# EasyEDA Pro project ProPrj_CraftVia-Station-S-v1-Rev0_2026-09-30.epro, schematic Schematic1, sheet 7 of 7

## Sheets
7 07_USB_ESP: Create Date: 2026-09-25; Page Name: 07_USB_ESP; Update Date: 2026-09-25
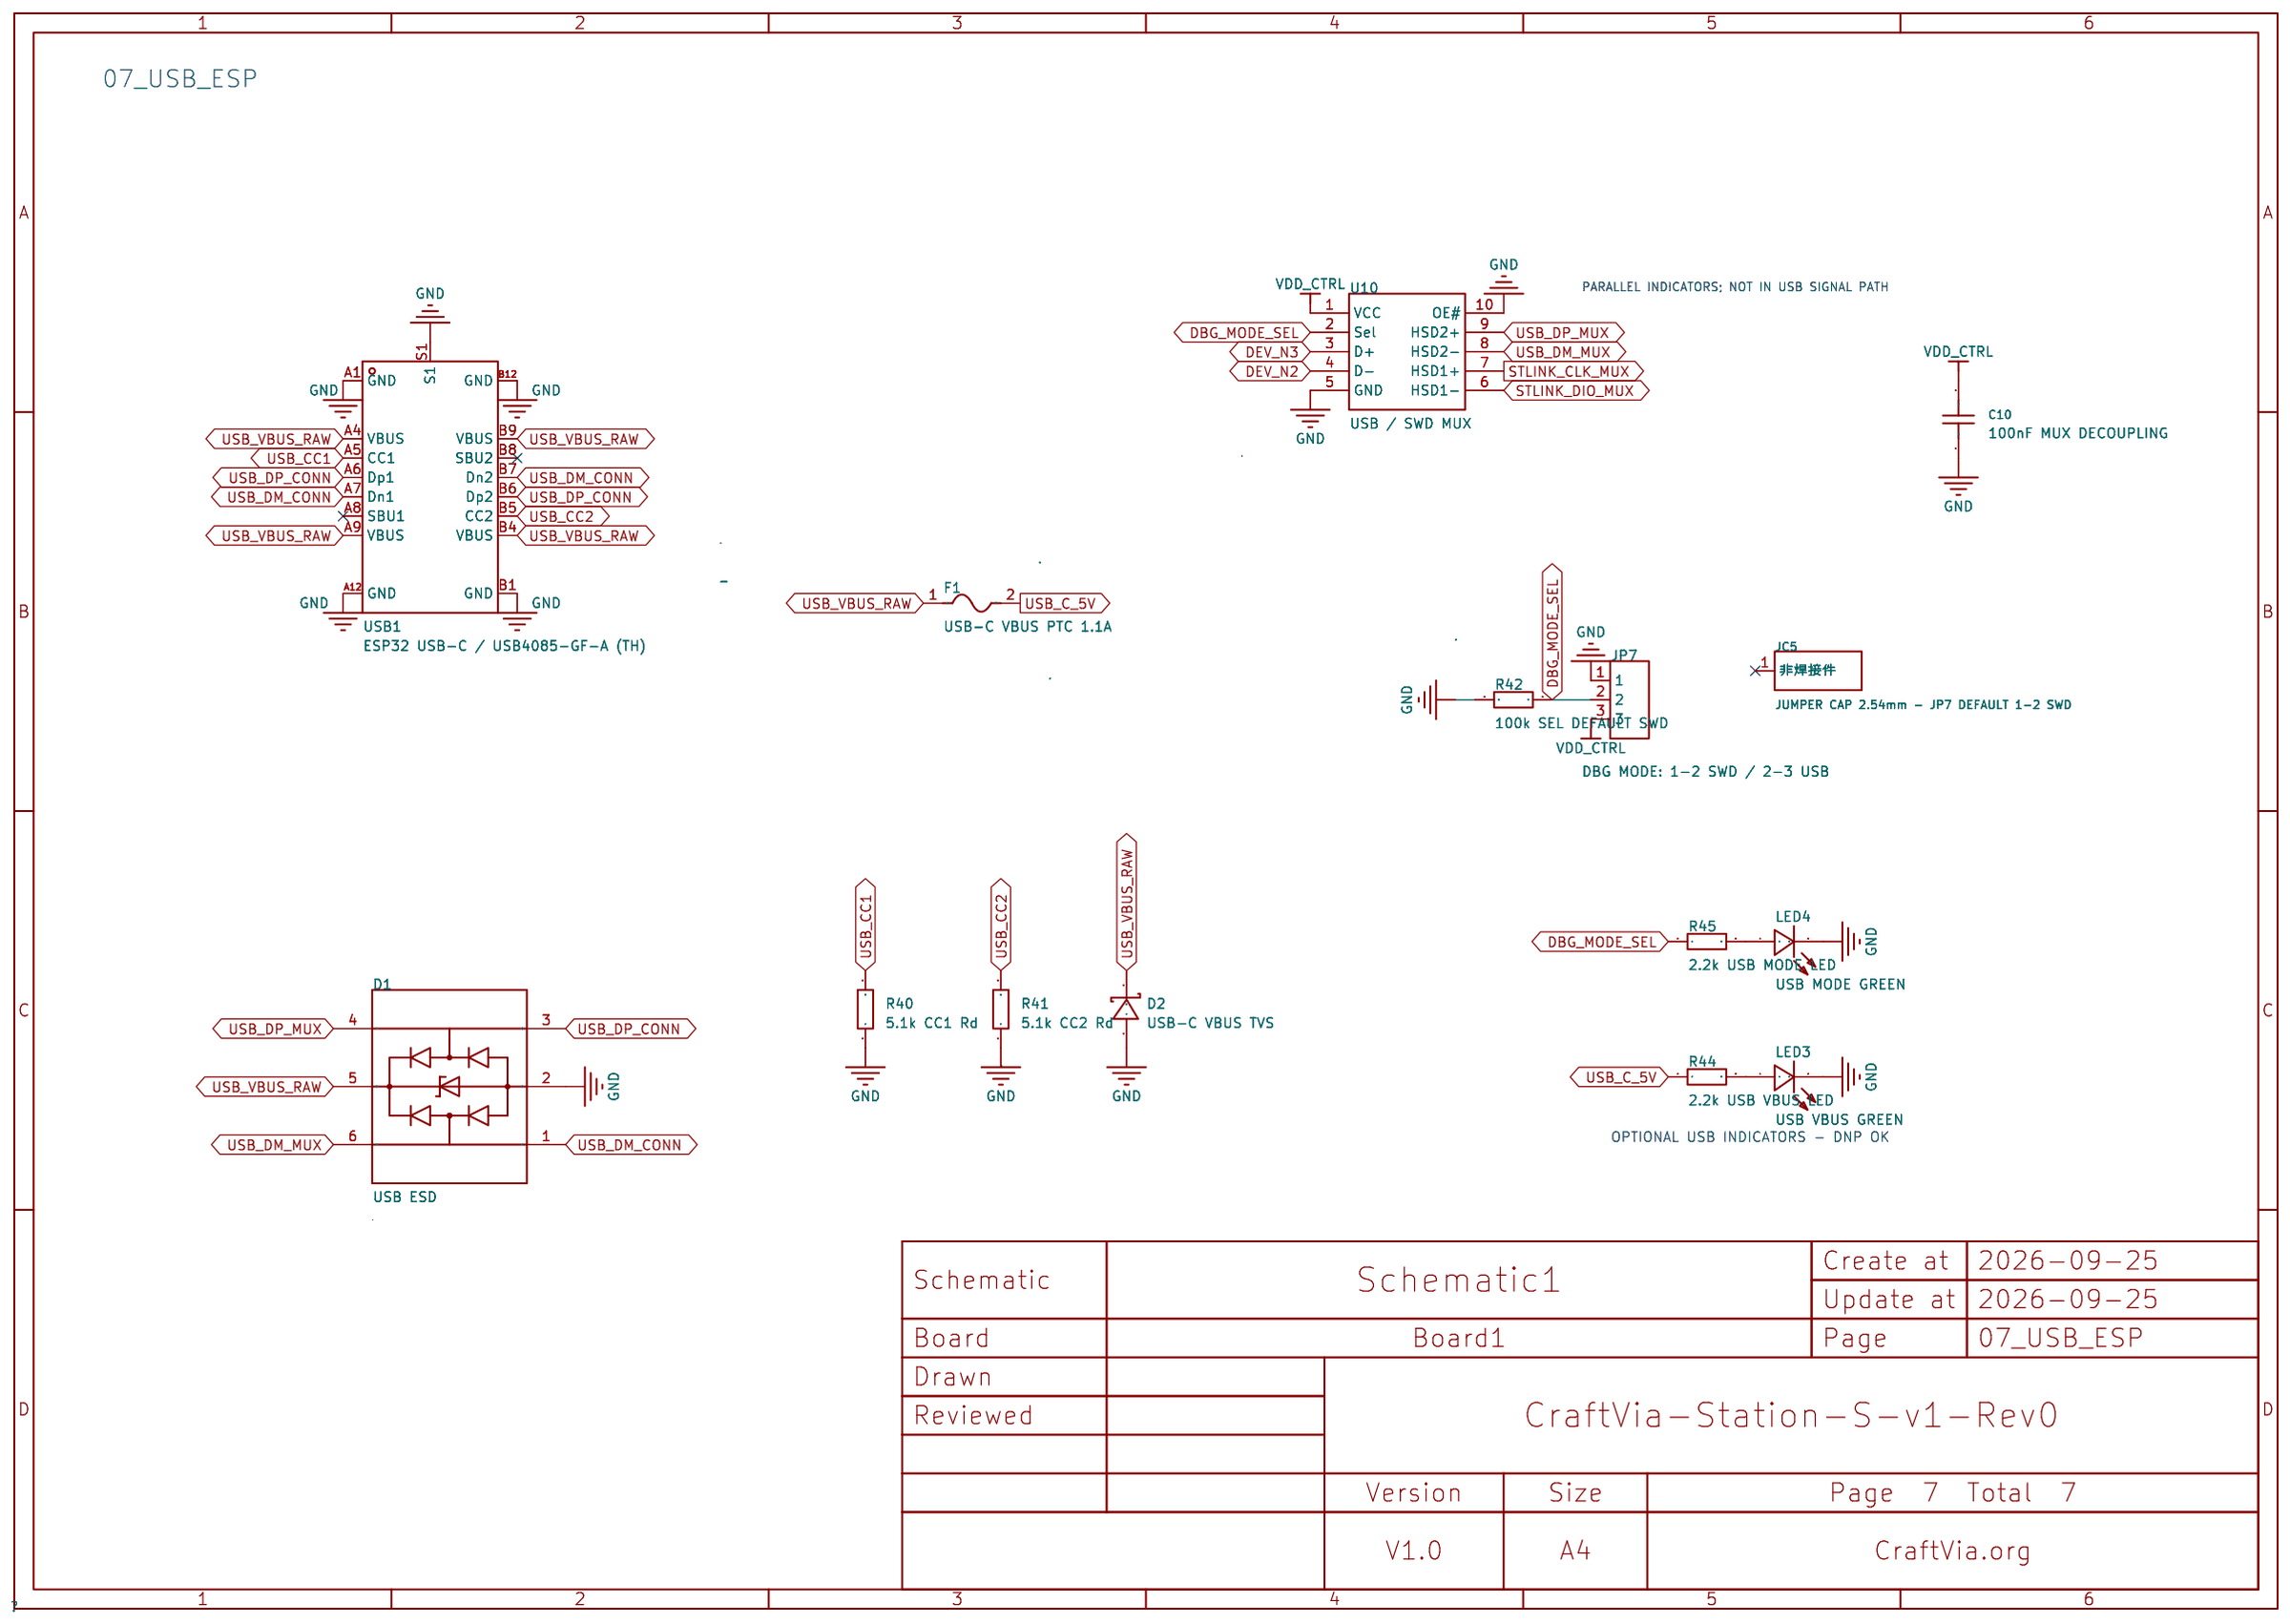
[diagram p6: 07_USB_ESP]

## Parts
C10  100nF  [C0603]
D1  USB ESD  [SOT-23-6_L2.9-W1.6-P0.95-LS2.8-BL]
D2  USB-C VBUS TVS  [SOD-123_L2.8-W1.8-LS3.7-RD]
F1  USB-C VBUS PTC 1.1A  [F1812]
JC5  JUMPER CAP 2.54mm - JP7 DEFAULT 1-2 SWD  [FL_001]
JP7  DBG MODE: 1-2 SWD / 2-3 USB  [HDR-TH_3P-P2.54-V-M_PZ254V-11-03P]
LED3  USB VBUS GREEN  [LED0805-R-RD]
LED4  USB MODE GREEN  [LED0805-R-RD]
R40  5.1kΩ  [R0603]
R41  5.1kΩ  [R0603]
R42  100kΩ  [R0603]
R44  2.2kΩ  [R0603]
R45  2.2kΩ  [R0603]
U10  USB / SWD MUX  [MSOP-10_L3.0-W3.0-P0.50-LS5.0-BL]
USB1  ESP32 USB-C / USB4085-GF-A (TH)  [USC-C-SMD_USB4085-GF-A]

## Library data of the parts
C10 = CL10B104KB8NNNC: Capacitance:100nF Tolerance:±10% Tolerance:±10% Voltage Rating:50V Temperature Coefficient:X7R; LCSC Part Name: 100nF ±10% 50V; Supplier Part: CL10B104KB8NNNC.1; Manufacturer: SAMSUNG(三星); Supplier Footprint: 0603; JLCPCB Part Class: Extended Part; Datasheet: https://item.szlcsc.com/datasheet/CL10B104KB8NNNC/1943.html; Supplier: LCSC; Tolerance: ±10%; Voltage Rating: 50V; Temperature Coefficient: X7R
D1 = USBLC6-2SC6: Reverse Stand-Off Voltage (Vrwm):5V Maximum Clamping Voltage:20V Peak Pulse Current (Ipp)@10/1000us:5A Breakdown Voltage:6V Type:ESD; LCSC Part Name: ESD二极管 USBLC6-2SC6; Supplier Part: USBLC6-2SC6_C323793.1; Supplier Footprint: SOT-23-6; JLCPCB Part Class: Extended Part; Datasheet: https://atta.szlcsc.com/upload/public/pdf/source/20181029/C323793_48F7908330A3F84485333C8DC43F9E49.pdf; Supplier: LCSC; Reverse Stand-Off Voltage (Vrwm): 5V; Maximum Clamping Voltage: 20V; Peak Pulse Current (Ipp)@10/1000us: 5A; Breakdown Voltage: 6V; Type: ESD
D2 = SMF5.0A: Reverse Stand-Off Voltage (Vrwm):5V Maximum Clamping Voltage:9.2V Peak Pulse Current (Ipp)@10/1000us:21.7A Breakdown Voltage:6.4V Type:TVS; Supplier Part: SMF5.0A.1; Supplier Footprint: SOD-123; JLCPCB Part Class: Extended Part; Datasheet: https://atta.szlcsc.com/upload/public/pdf/source/20180528/C132591_2E6627FA8E0A601785D44BCCBB8E552F.pdf; Supplier: LCSC; Reverse Stand-Off Voltage (Vrwm): 5V; Maximum Clamping Voltage: 9.2V; Peak Pulse Current (Ipp)@10/1000us: 21.7A; Breakdown Voltage: 6.4V; Type: TVS
F1 = MF-MSMF050-2: USB-C VBUS resettable PTC, 1.1A hold / 2.2A trip, 16V, 1812; LCSC Part Name: 16V 1.1A 1812 Resettable PTC; Supplier Part: C210834; Manufacturer: BOURNS; Manufacturer Part: MF-MSMF110/16-2; Supplier Footprint: 1812; JLCPCB Part Class: Extended Part; Datasheet: https://item.szlcsc.com/datasheet/MF-MSMF110%252F16-2/211712.html; Supplier: LCSC; Voltage - Max: 16V; Current - Max: 100A; Hold Current: 1.1A; Trip Current: 2.2A; Power Dissipation: 800mW; Resistance - Initial (Ri) (Min): 40mohm; Resistance - Post Trip (R1) (Max): 210mohm; Time to Trip(Max): 300ms; Operating Temperature: -40C to +85C; Length: 5.4mm; Width: 3.2mm; Height: 0.85mm
JC5 = 2.54短路帽开口: Number of Positions or Pins:1x2 Pitch:2.54mm Open Top/Close Top:Open-Top Current Rating:3A colour:Black Long Handle or Not:Unshrouded; LCSC Part Name: 2.54mm 开顶式; Supplier Part: 2.54短路帽开口.1; Manufacturer: BOOMELE(博穆精密); Supplier Footprint: P=2.54mm; JLCPCB Part Class: Extended Part; Datasheet: https://item.szlcsc.com/datasheet/2.54%25E7%259F%25AD%25E8%25B7%25AF%25E5%25B8%25BD%25E5%25BC%2580%25E5%258F%25A3/5732.html; Supplier: LCSC; Number of Positions or Pins: 1x2; Pitch: 2.54mm; Open Top/Close Top: Open-Top; Current Rating: 3A; colour: Black; Long Handle or Not: Unshrouded
JP7 = PZ254V-11-03P: Pin Structure:1x3P Pitch:2.54mm Row Spacing:- Circluar Pins/Square Pins:Square pin Mounting Type:Through Hole Number of Rows:1 Number of Pins:3P Current Rating:3A Voltage Rating (Max):250V Length of Mating Pin:6.1mm Insulation Height:2.5mm Length of End C; LCSC Part Name: 1x3P 间距:2.54mm 方针 直插; Supplier Part: PZ254V-11-03P_C2937625.1; Manufacturer: XFCN(兴飞); Supplier Footprint: 插件,P=2.54mm; JLCPCB Part Class: Extended Part; Datasheet: https://item.szlcsc.com/datasheet/PZ254V-11-03P/3293280.html; Supplier: LCSC; Pin Structure: 1x3P; Pitch: 2.54mm; Circluar Pins/Square Pins: Square pin; Mounting Type: Through Hole; Number of Rows: 1; Number of Pins: 3P; Current Rating: 3A; Voltage Rating (Max): 250V; Length of Mating Pin: 6.1mm; Insulation Height: 2.5mm; Length of End Connection Pin: 3mm; Contact Material: Brass; Contact Plating: Gold; Operating Temperature: -40℃~+105℃; Color: Black
LED3 LED4 = KT-0805G: Lamp Holder Type:2mm x 1.25mm square LED Illumination Color:Emerald Green Voltage - Forward(Vf):2.6V~3.1V Voltage - Forward(Vf):2.6V~3.1V Power(Watts):100mW Forward Current:5mA Wavelength - Dominant:513nm~528nm Wavelength - Dominant:513nm~528nm Peak Wavel; LCSC Part Name: 0805 翠绿 高亮; Supplier Part: 0805G (Green).1; Manufacturer: KENTO; Supplier Footprint: 0805; JLCPCB Part Class: Basic Part; Datasheet: https://item.szlcsc.com/datasheet/KT-0805G/2670.html; Supplier: LCSC; Lamp Holder Type: 2mm x 1.25mm square LED; Illumination Color: Emerald Green; Voltage - Forward(Vf): 2.6V~3.1V; Power(Watts): 100mW; Forward Current: 5mA; Wavelength - Dominant: 513nm~528nm; Peak Wavelength: 525nm; Diode Configuration: Discrete Diode; Lens Color: Water Clear; Luminous Intensity: 430mcd; Viewing Angle: 120°; Operating Temperature: -40℃~+85℃
R40 R41 = 0603WAF5101T5E: Type:Thick Film Resistor Resistance:5.1kΩ Tolerance:±1% Tolerance:±1% Power(Watts):100mW Voltage-Supply(Max):75V Temperature Coefficient:±100ppm/℃ Temperature Coefficient:±100ppm/℃ Operating Temperature:-55℃~+155℃ Operating Temperature:-55℃~+155℃; LCSC Part Name: 5.1kΩ ±1% 100mW 厚膜电阻; Supplier Part: 0603WAF5101T5E.1; Manufacturer: UNI-ROYAL(厚声); Supplier Footprint: 0603; JLCPCB Part Class: Basic Part; Datasheet: https://item.szlcsc.com/datasheet/0603WAF5101T5E/23913.html; Supplier: LCSC; Type: Thick Film Resistor; Tolerance: ±1%; Power(Watts): 100mW; Voltage-Supply(Max): 75V; Temperature Coefficient: ±100ppm/℃; Operating Temperature: -55℃~+155℃
R42 = 0603WAF1003T5E: Type:Thick Film Resistor Resistance:100kΩ Tolerance:±1% Tolerance:±1% Power(Watts):100mW Voltage-Supply(Max):75V Temperature Coefficient:±100ppm/℃ Temperature Coefficient:±100ppm/℃ Operating Temperature:-55℃~+155℃ Operating Temperature:-55℃~+155℃; LCSC Part Name: 厚膜电阻 100kΩ ±1%; Supplier Part: 0603WAF1003T5E.1; Manufacturer: UNI-ROYAL(厚声); Supplier Footprint: 0603; JLCPCB Part Class: Basic Part; Datasheet: https://item.szlcsc.com/datasheet/0603WAF1003T5E/26546.html; Supplier: LCSC; Type: Thick Film Resistor; Tolerance: ±1%; Power(Watts): 100mW; Voltage-Supply(Max): 75V; Temperature Coefficient: ±100ppm/℃; Operating Temperature: -55℃~+155℃
R44 R45 = 0603WAF2201T5E_C4190: Type:Thick Film Resistor Resistance:2.2kΩ Tolerance:±1% Tolerance:±1% Power(Watts):100mW Voltage-Supply(Max):75V Temperature Coefficient:±100ppm/℃ Temperature Coefficient:±100ppm/℃ Operating Temperature:-55℃~+155℃ Operating Temperature:-55℃~+155℃; LCSC Part Name: 厚膜电阻 2.2kΩ ±1%; Supplier Part: 0603WAF2201T5E.1; Manufacturer: UNI-ROYAL(厚声); Manufacturer Part: 0603WAF2201T5E; Supplier Footprint: 0603; JLCPCB Part Class: Basic Part; Datasheet: https://item.szlcsc.com/datasheet/0603WAF2201T5E/4597.html; Supplier: LCSC; Type: Thick Film Resistor; Tolerance: ±1%; Power(Watts): 100mW; Voltage-Supply(Max): 75V; Temperature Coefficient: ±100ppm/℃; Operating Temperature: -55℃~+155℃
U10 = FSUSB42MUX: Switch Circuit:2:1 Number of Channels:2 Ron:3.9Ω Voltage - Supply:3V~4.4V Voltage - Supply:3V~4.4V Con:3.7pF Turn-on time:13ns Turn-off time:12ns Bandwidth:720MHz Operating Temperature:-40℃~+85℃ Operating Temperature:-40℃~+85℃ Propagation Delay (tpd):250p; LCSC Part Name: 低功耗，双端口，高速USB2.0 (480Mbps) UART开关; Supplier Part: FSUSB42MUX.1; Manufacturer: onsemi(安森美); Supplier Footprint: MSOP-10; JLCPCB Part Class: Extended Part; Datasheet: https://item.szlcsc.com/datasheet/FSUSB42MUX/11908.html; Supplier: LCSC; Switch Circuit: 2:1; Number of Channels: 2; Ron: 3.9Ω; Voltage - Supply: 3V~4.4V; Con: 3.7pF; Turn-on time: 13ns; Turn-off time: 12ns; Bandwidth: 720MHz; Operating Temperature: -40℃~+85℃; Propagation Delay (tpd): 250ps; Features: Bidirectional analog channel；Fault protection
USB1 = USB4085-GF-A_C7095263: Connector Type:Type-C Protocol Standard:USB 2.0 Gender:Female Mounting Type:Right Angle Number of Ports:1 Current Rating-Power:5A Voltage Rating:48V Detection color:Black Operating Temperature:-40℃~+85℃ Operating Temperature:-40℃~+85℃; LCSC Part Name: Type-C 母 弯插; Supplier Part: C7095263; Manufacturer: GCT; Manufacturer Part: USB4085-GF-A; Supplier Footprint: 插件; JLCPCB Part Class: Extended Part; Datasheet: https://item.szlcsc.com/datasheet/USB4085-GF-A/8061907.html; Supplier: LCSC; Connector Type: Type-C; Protocol Standard: USB 2.0; Gender: Female; Mounting Type: Right Angle; Number of Ports: 1; Current Rating-Power: 5A; Voltage Rating: 48V; Detection color: Black; Operating Temperature: -40℃~+85℃

## Nets
GND: C10.1 D1.2 D2.2(A) JP7.1 LED3.2(K) LED4.2(K) R40.1 R41.1 R42.1 U10.5(GND) U10.10(OE#) USB1.A1(GND) USB1.A12(GND) USB1.B1(GND) USB1.B12(GND) USB1.S1 ; also on sheet 1 2 3 4 5 6
VDD_CTRL: C10.2 JP7.3 U10.1(VCC) ; also on sheet 1 4 5 6
DBG_MODE_SEL: JP7.2 R42.2 R45.1 U10.2(Sel)
DEV_N2: U10.4(D-) ; also on sheet 2 3
DEV_N3: U10.3(D+) ; also on sheet 2 3
STLINK_CLK_MUX: U10.7(HSD1+) ; also on sheet 2
STLINK_DIO_MUX: U10.6(HSD1-) ; also on sheet 2
USB_C_5V: F1.2 R44.1 ; also on sheet 1
USB_CC1: R40.2 USB1.A5(CC1)
USB_CC2: R41.2 USB1.B5(CC2)
USB_DM_CONN: D1.1 USB1.A7(Dn1) USB1.B7(Dn2)
USB_DM_MUX: D1.6 U10.8(HSD2-)
USB_DP_CONN: D1.3 USB1.A6(Dp1) USB1.B6(Dp2)
USB_DP_MUX: D1.4 U10.9(HSD2+)
USB_VBUS_RAW: D1.5 D2.1(K) F1.1 USB1.A4(VBUS) USB1.A9(VBUS) USB1.B4(VBUS) USB1.B9(VBUS)
$9N133: LED4.1(A) R45.2
$9N138: LED3.1(A) R44.2

Not connected (* = marked no-connect by the designer): JC5 1(非焊接件)*; USB1 A8(SBU1)* B8(SBU2)*

## Notes on the sheets
sheet 7
- 07_USB_ESP
- PARALLEL INDICATORS; NOT IN USB SIGNAL PATH
- JP7: 1-2 SWD (DEFAULT) / 2-3 USB
- Core-S N2 = USB D- / SWDIO, N3 = USB D+ / SWCLK
- USB-C VBUS PROTECTION
- USB-C / ESP32 NATIVE USB + DEBUG PATH
- Fit one jumper only. R42 defaults to SWD if open.
- USB_C_5V reaches SYS_5V only via JP1 pins 1-2 on 01_PWR_MEAS.
- CC1/CC2: 5.1k Rd (USB DEVICE)
- OPTIONAL USB INDICATORS - DNP OK
- HSD1 = STLINK SWD, HSD2 = USB
